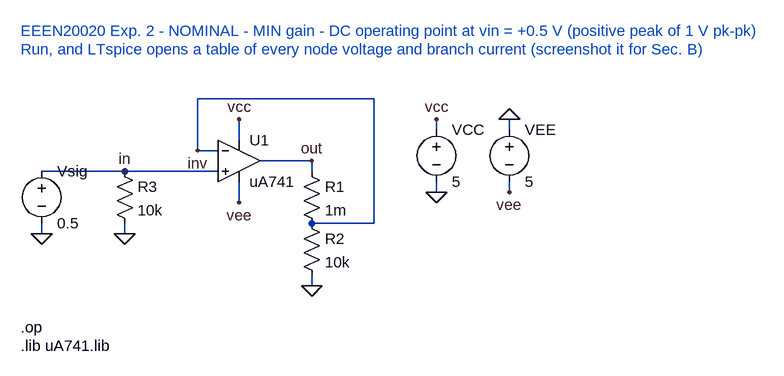
[diagram p0: schematic exp2_nominal_op_min.asc]
exp2_nominal_op_min.asc, the LTspice schematic file:
Version 4
SHEET 1 1240 900
WIRE 96 240 224 240
WIRE 224 240 368 240
WIRE 432 224 512 224
WIRE 512 224 512 240
WIRE 368 208 336 208
WIRE 336 208 336 128
WIRE 336 128 608 128
WIRE 608 128 608 320
WIRE 608 320 512 320
WIRE 400 192 400 160
WIRE 400 256 400 288
WIRE 704 176 704 160
WIRE 704 256 704 272
WIRE 816 176 816 160
WIRE 816 256 816 272
WIRE 96 320 96 336
WIRE 224 320 224 336
WIRE 512 400 512 416
FLAG 96 336 0
FLAG 224 336 0
FLAG 512 416 0
FLAG 704 272 0
FLAG 816 160 0
FLAG 224 240 in
FLAG 512 224 out
FLAG 336 208 inv
FLAG 400 160 vcc
FLAG 704 160 vcc
FLAG 400 288 vee
FLAG 816 272 vee
SYMBOL voltage 96 224 R0
SYMATTR InstName Vsig
SYMATTR Value 0.5
SYMBOL res 208 224 R0
SYMATTR InstName R3
SYMATTR Value 10k
SYMBOL Opamps\\opamp2 400 160 R0
SYMATTR InstName U1
SYMATTR Value uA741
SYMBOL res 496 224 R0
SYMATTR InstName R1
SYMATTR Value 1m
SYMBOL res 496 304 R0
SYMATTR InstName R2
SYMATTR Value 10k
SYMBOL voltage 704 160 R0
SYMATTR InstName VCC
SYMATTR Value 5
SYMBOL voltage 816 160 R0
SYMATTR InstName VEE
SYMATTR Value 5
TEXT 64 24 Left 2 ;EEEN20020 Exp. 2 - NOMINAL - MIN gain - DC operating point at vin = +0.5 V (positive peak of 1 V pk-pk)
TEXT 64 52 Left 2 ;Run, and LTspice opens a table of every node voltage and branch current (screenshot it for Sec. B)
TEXT 64 480 Left 2 !.op
TEXT 64 508 Left 2 !.lib uA741.lib

The netlist it stands for:
* exp2_nominal_op_min.asc
Vsig in 0 0.5
R3 in 0 10k
XU1 in inv vcc vee out uA741  ; pins In+ In- V+ V- OUT
R1 out inv 1m
R2 inv 0 10k
VCC vcc 0 5
VEE 0 vee 5
* EEEN20020 Exp. 2 - NOMINAL - MIN gain - DC operating point at vin = +0.5 V (positive peak of 1 V pk-pk)
* Run, and LTspice opens a table of every node voltage and branch current (screenshot it for Sec. B)
.op
.lib uA741.lib
.backanno
.end